# Altium schematic sheet Analog frontend.SchDoc: Analog ECG Frontend
size A4; SheetNumber: 1; SheetTotal: 5
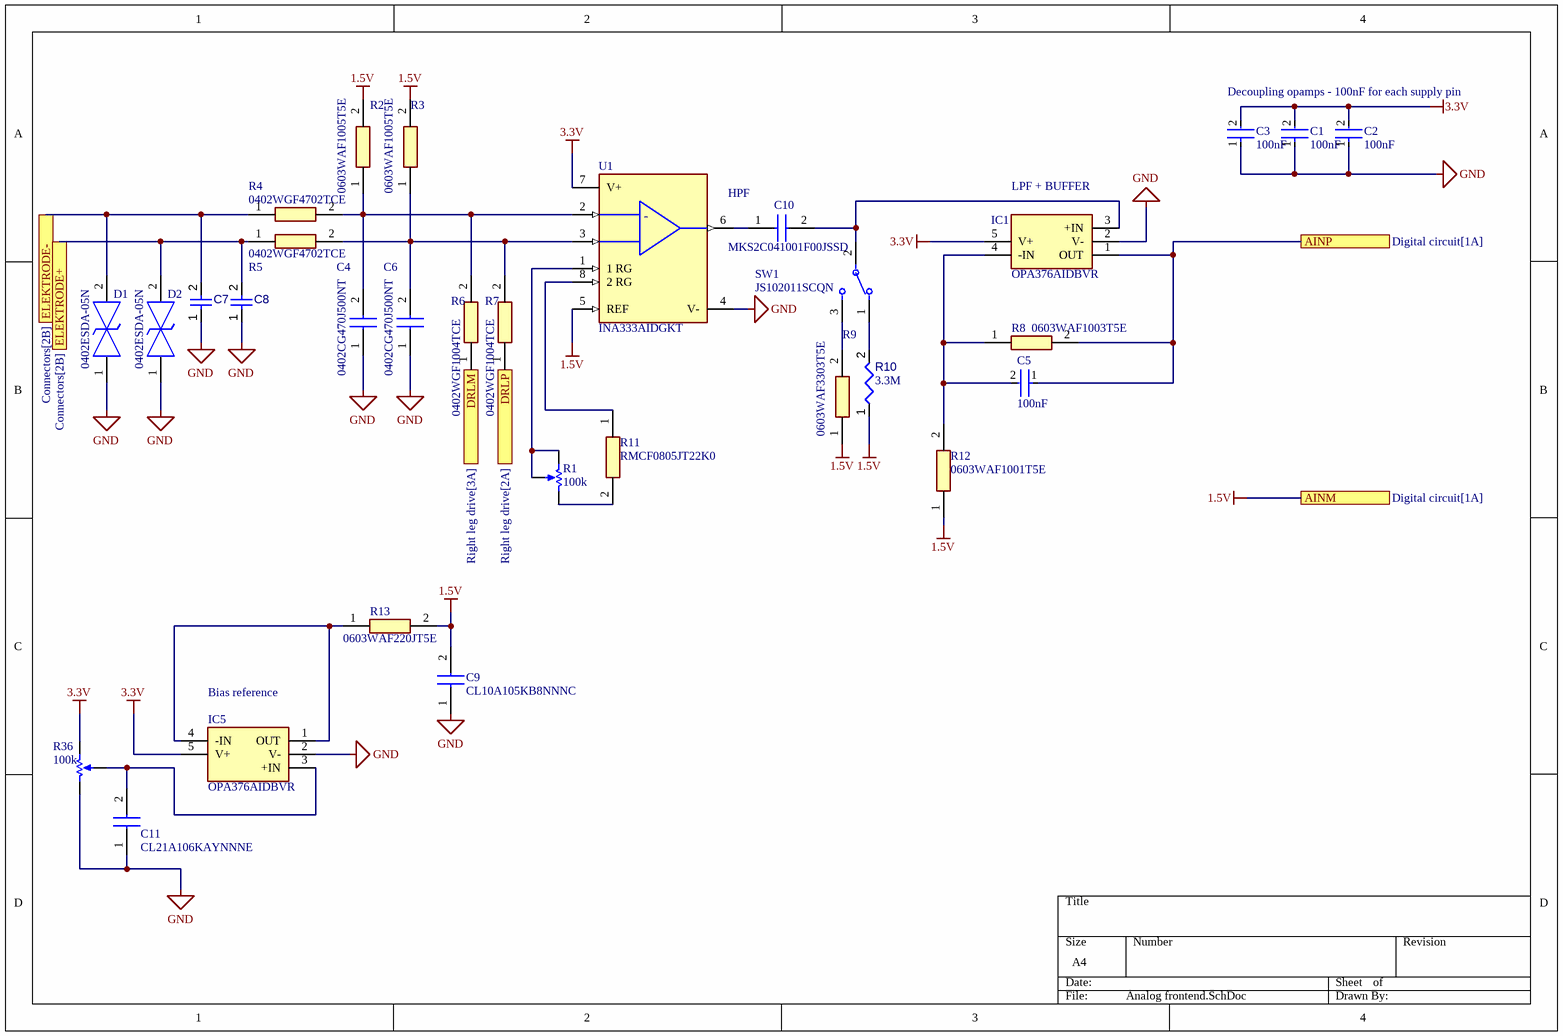
[diagram p0: Analog frontend.SchDoc]

## Parts
C1  value 100nF  [FP-CC0603-DA-IPC_B]  (hidden comment: CC0603KRX7R9BB104)
C2  value 100nF  [FP-CC0603-DA-IPC_B]  (hidden comment: CC0603KRX7R9BB104)
C3  value 100nF  [FP-CC0603-DA-IPC_B]  (hidden comment: CC0603KRX7R9BB104)
C4  0402CG470J500NT  [CAPC1005X55N]
C5  value 100nF  [FP-CC0603-DA-IPC_B]  (hidden comment: CC0603KRX7R9BB104)
C6  0402CG470J500NT  [CAPC1005X55N]
C7  TCC0402COG220J500AT  [TCC0402COG220J500AT]  (value not drawn)
C8  TCC0402COG220J500AT  [TCC0402COG220J500AT]  (value not drawn)
C9  CL10A105KB8NNNC  [CAPC1608X90N]
C10  MKS2C041001F00JSSD  [MKS2C041001F00JSSD]
C11  CL21A106KAYNNNE  [CAPC2012X145N]
D1  0402ESDA-05N  [DIONC1005X60N]
D2  0402ESDA-05N  [DIONC1005X60N]
IC1  OPA376AIDBVR  [SOT95P280X145-5N]
IC5  OPA376AIDBVR  [SOT95P280X145-5N]
R1  value 100k  [BOUR-3266W-3_V]  (hidden comment: 3266W-1-104LF)
R2  0603WAF1005T5E  [RESC1608X55N]
R3  0603WAF1005T5E  [RESC1608X55N]
R4  0402WGF4702TCE  [RESC1005X40N]
R5  0402WGF4702TCE  [RESC1005X40N]
R6  0402WGF1004TCE  [RESC1005X40N]
R7  0402WGF1004TCE  [RESC1005X40N]
R8  0603WAF1003T5E  [RESC1608X55N]
R9  0603WAF3303T5E  [RESC1608X55N]
R10  value 3.3M  [0603WAF3304T5E]  (hidden comment: 0603WAF3304T5E)
R11  RMCF0805JT22K0  [RESC2012X65N]
R12  0603WAF1001T5E  [RESC1608X55N]
R13  0603WAF220JT5E  [RESC1608X55N]
R36  value 100k  [BOUR-3266W-3_V]  (hidden comment: 3266W-1-104LF)
SW1  JS102011SCQN  [FP-JS102011SCQN-MFG]
U1  INA333AIDGKT  [FP-DGK0008A-IPC_B]

## Ports
AINM (see Digital circuit[1A]), AINP (see Digital circuit[1A]), DRLM (see Right leg drive[3A]), DRLP (see Right leg drive[2A]), ELEKTRODE+ (see Connectors[2B]), ELEKTRODE- (see Connectors[2B])

## Nets
1.5V: C9.2 R2.2 R3.2 R9.1 R10.1 R12.1 R13.2 U1.5(REF) ; port AINM
3.3V: C1.2 C2.2 C3.2 IC1.5(V+) IC5.5(V+) R36.1(CCW) U1.7(V+)
GND: C1.1 C2.1 C3.1 C4.1 C6.1 C7.1 C8.1 C9.1 C11.1 D1.1 D2.1 IC1.2(V-) IC5.2(V-) R36.3(CW) U1.4(V-)
AINP: C5.1 IC1.1(OUT) R8.2 ; port AINP
DRLM: R6.1 ; port DRLM
DRLP: R7.1 ; port DRLP
ELEKTRODE+: C8.2 D2.2 R5.1 ; port ELEKTRODE+
ELEKTRODE-: C7.2 D1.2 R4.1 ; port ELEKTRODE-
NetC4_2: C4.2 R2.1 R4.2 R6.2 U1.2(VIN-)
NetC5_2: C5.2 IC1.4(-IN) R8.1 R12.2
NetC6_2: C6.2 R3.1 R5.2 R7.2 U1.3(VIN+)
NetC10_1: C10.1 U1.6(VOUT)
NetC10_2: C10.2 IC1.3(+IN) SW1.2(C)
NetC11_2: C11.2 IC5.3(+IN) R36.2(WIPER)
NetIC5_1: IC5.1(OUT) IC5.4(-IN) R13.1
NetR1_1: R1.1(CCW) R11.2
NetR1_2: R1.2(WIPER) R1.3(CW) U1.1(1_RG)
NetR9_2: R9.2 SW1.3
NetR10_2: R10.2 SW1.1
NetR11_1: R11.1 U1.8(2_RG)

## Notes on the sheet
- Decoupling opamps - 100nF for each supply pin
- (near U1) HPF
- (near IC1) LPF + BUFFER
- (near IC5) Bias reference
- (in symbol CMP-014-00006-1) -

## Library data of the parts
C1-C3 C5 = CMP-001-00148-1: Multilayer Ceramic Capacitor, CC Series, 0.1 - F, - 10%, X7R, 50 V, 0603 [1608 Metric]; Voltage Rating: 50V; Mounting Technology: Surface Mount; Tolerance: 10%; Case/Package: 0603; Max Operating Temperature: 125°C; Min Operating Temperature: -55°C; Pins: 2; Lead Free: Lead Free; Case Code (Metric): 1608; Width: 800µm; Termination: SMD/SMT; Depth: 800µm; RoHS: Compliant; Material: Ceramic; Dielectric: X7R; Schedule B: 8532240020, 8532240020; Country of Origin: Mainland China, Taiwan; Lifecycle Status: Production; Radiation Hardening: No; Case Code (Imperial): 0603; Height: 800µm; Number of Terminals: 2; China RoHS: Compliant; Voltage Rating (DC): 50V; Export Control Classification Number (ECCN) Code: EAR99; Halogen Free: Halogen Free; Thickness: 889µm; Voltage: 50V; Length: 1.6mm; Harmonized Tariff Schedule (HTS) Code: 8532.24.00.20; REACH SVHC: Unaffected; Introduction Date: 2005-08-18; Dielectric Material: Ceramic
C4 C6 = 0402CG470J500NT: Capacitor; Manufacturer_Name: Guangdong Fenghua Advanced Tech; Datasheet Link: https://datasheet.lcsc.com/szlcsc/Guangdong-Fenghua-Advanced-Tech-0402CG470J500NT_C1567.pdf; Height: 0.55mm; Manufacturer_Part_Number: 0402CG470J500NT
C7 C8 = CMP-001-00152-1: 50V 22pF C0G ±5% 0402 Multilayer Ceramic Capacitors MLCC - SMD/SMT ROHS
C9 = CL10A105KB8NNNC: Capacitor; Manufacturer_Name: SAMSUNG; Datasheet Link: https://datasheet.datasheetarchive.com/originals/distributors/Datasheets-DGA10/2411562.pdf; Height: 0.9mm; Manufacturer_Part_Number: CL10A105KB8NNNC; Mouser Part Number: 187-CL10A105KB8NNNC; Mouser Price/Stock: https://www.mouser.co.uk/ProductDetail/Samsung-Electro-Mechanics/CL10A105KB8NNNC?qs=ktYoCbbtCSJz4pFCLWXd5g%3D%3D; Arrow Part Number: CL10A105KB8NNNC; Arrow Price/Stock: https://www.arrow.com/en/products/cl10a105kb8nnnc/samsung-electro-mechanics.html?utm_currency=USD&region=nac
C10 = MKS2C041001F00JSSD: Capacitor; Manufacturer_Name: WIMA; Datasheet Link: https://www.digikey.com/en/products/detail/wima/MKS2C041001F00JSSD/19251598; Height: 10mm; Manufacturer_Part_Number: MKS2C041001F00JSSD; Mouser Part Number: 505-MKS21.0/63/5; Mouser Price/Stock: https://www.mouser.co.uk/ProductDetail/WIMA/MKS2C041001F00JSSD?qs=ISKKXg98%252B1lQgUuGZjf9mQ%3D%3D; Arrow Part Number: MKS2C041001F00JSSD; Arrow Price/Stock: https://www.arrow.com/en/products/mks2c041001f00jssd/wima?region=europe
C11 = CL21A106KAYNNNE: Capacitor; Manufacturer_Name: SAMSUNG; Datasheet Link: https://datasheet.datasheetarchive.com/originals/distributors/Datasheets_SAMA/6a45835c9b7400e9b49c55c38a8ff4a2.pdf; Height: 1.45mm; Manufacturer_Part_Number: CL21A106KAYNNNE; Mouser Part Number: 187-CL21A106KAYNNNE; Mouser Price/Stock: https://www.mouser.co.uk/ProductDetail/Samsung-Electro-Mechanics/CL21A106KAYNNNE?qs=yOVawPpwOwmTXAd4dJtNjA%3D%3D; Arrow Part Number: CL21A106KAYNNNE; Arrow Price/Stock: https://www.arrow.com/en/products/cl21a106kaynnne/samsung-electro-mechanics.html?utm_currency=USD&region=nac
D1 D2 = 0402ESDA-05N: TVS Diode (Bi-directional); Manufacturer_Name: Bourne Semicon; Datasheet Link: https://datasheet.lcsc.com/szlcsc/1811061308_Bourne-Semicon-Shenzhen-0402ESDA-05N_C316049.pdf; Height: 0.6mm; Manufacturer_Part_Number: 0402ESDA-05N
IC1 IC5 = OPA376AIDBVR: Integrated Circuit; Manufacturer_Name: Texas Instruments; Datasheet Link: http://www.ti.com/lit/gpn/OPA376; Height: 1.45mm; Manufacturer_Part_Number: OPA376AIDBVR; Mouser Part Number: 595-OPA376AIDBVR; Mouser Price/Stock: https://www.mouser.co.uk/ProductDetail/Texas-Instruments/OPA376AIDBVR?qs=xL7PkI2RoJ57GVtJklM7uw%3D%3D; Arrow Part Number: OPA376AIDBVR; Arrow Price/Stock: https://www.arrow.com/en/products/opa376aidbvr/texas-instruments.html?utm_currency=USD&region=europe
R1 R36 = CMP-009-00233-1: Trimmer, Cermet, Rest 100 Kilohms, Pcb, Pwr-rtg 0.25W, Dim 0.264INLX0.177INWX0.285INH; Insulation Resistance: 1GΩ; Lead Length: 4.88mm; Lead Diameter: 460µm; Voltage Rating: 300V; Max Power Dissipation: 250mW; Pitch: 2.54mm; Number of Turns: 12; Tolerance: 10%; Temperature Coefficient: 100ppm/°C; Composition: Cermet; Number of Terminals: 3; Military Standard: Not; REACH SVHC: Affected; Thickness: 5.59mm; Taper: Linear; Max Operating Temperature: 125°C; Contact Plating: Tin; Depth: 4.5mm; RoHS: Compliant; Min Operating Temperature: -55°C; Pins: 3; Termination: Pin; Height: 7.24mm; Schedule B: 8533400080, 8533400080; Working Voltage: 300V; Voltage Rating (AC): 300V; Voltage Rating (DC): 300V; Width: 4.5mm; Radiation Hardening: No; Lifecycle Status: Production; Weight: 425.242847mg; Type: Potentiometer; Color: Blue; Length: 6.71mm; Power Rating: 250mW
R2 R3 = 0603WAF1005T5E: Resistor; Manufacturer_Name: ROYALOHM; Datasheet Link: https://eu.mouser.com/datasheet/3/5925/1/1.pdf; Height: 0.55mm; Manufacturer_Part_Number: 0603WAF1005T5E; Mouser Part Number: 303-0603WAF1005T5E; Mouser Price/Stock: https://www.mouser.co.uk/ProductDetail/Royalohm/0603WAF1005T5E?qs=e8oIoAS2J1TtIpBlPWLC5w%3D%3D
R4 R5 = 0402WGF4702TCE: Resistor; Manufacturer_Name: UNI-ROYAL(Uniroyal Elec); Datasheet Link: https://datasheet.lcsc.com/szlcsc/Uniroyal-Elec-0402WGF4702TCE_C25792.pdf; Height: 0.4mm; Manufacturer_Part_Number: 0402WGF4702TCE
R6 R7 = 0402WGF1004TCE: Resistor; Manufacturer_Name: ROYALOHM; Datasheet Link: https://www.mouser.ca/datasheet/2/1365/1-3044649.pdf; Height: 0.4mm; Manufacturer_Part_Number: 0402WGF1004TCE; Mouser Part Number: 303-0402WGF1004TCE; Mouser Price/Stock: https://www.mouser.co.uk/ProductDetail/Royalohm/0402WGF1004TCE?qs=e8oIoAS2J1Sm8qYhjADD%252Bg%3D%3D
R8 = 0603WAF1003T5E: Resistor; Manufacturer_Name: UNI-ROYAL(Uniroyal Elec); Datasheet Link: https://datasheet.lcsc.com/szlcsc/Uniroyal-Elec-0603WAF1003T5E_C25803.pdf; Height: 0.55mm; Manufacturer_Part_Number: 0603WAF1003T5E
R9 = 0603WAF3303T5E: Resistor; Manufacturer_Name: Uniroyal Elec; Datasheet Link: https://datasheet.lcsc.com/szlcsc/Uniroyal-Elec-0603WAF3303T5E_C23137.pdf; Height: 0.55mm; Manufacturer_Part_Number: 0603WAF3303T5E
R10 = CMP-009-00239-1: Res Thick Film 0603 3.3M Ohm 1% 0.1W(1/10W) ±100ppm/C Pad SMD T/R; Working Voltage: 75V; Power Rating: 100mW; Temperature Coefficient: 100ppm/°C; Lifecycle Status: Production; REACH SVHC: Unaffected; Case/Package: 0603; Number of Terminals: 2; Mounting Technology: Surface Mount; Width: 800µm; RoHS: Compliant; China RoHS: Non-Compliant; Length: 1.6mm; Tolerance: 1%; Max Operating Temperature: 155°C; Height: 450µm; Min Operating Temperature: -55°C
R11 = RMCF0805JT22K0: Resistor; Manufacturer_Name: Stackpole Electronics; Datasheet Link: https://cs.seielect.com/catalog/SEI-RMCF_RMCP.pdf; Height: 0.65mm; Manufacturer_Part_Number: RMCF0805JT22K0; Mouser Part Number: 708-RMCF0805JT22K0; Mouser Price/Stock: https://www.mouser.co.uk/ProductDetail/SEI-Stackpole/RMCF0805JT22K0?qs=FESYatJ8odJj8AR7KQYlug%3D%3D; Arrow Part Number: RMCF0805JT22K0; Arrow Price/Stock: https://www.arrow.com/en/products/rmcf0805jt22k0/stackpole-electronics?region=nac
R12 = 0603WAF1001T5E: Resistor; Manufacturer_Name: UNI-ROYAL(Uniroyal Elec); Datasheet Link: https://datasheet.lcsc.com/szlcsc/Uniroyal-Elec-0603WAF1001T5E_C21190.pdf; Height: 0.55mm; Manufacturer_Part_Number: 0603WAF1001T5E
R13 = 0603WAF220JT5E: Resistor; Manufacturer_Name: UNI-ROYAL(Uniroyal Elec); Datasheet Link: https://www.lcsc.com/datasheet/lcsc_datasheet_2206010100_UNI-ROYAL-Uniroyal-Elec-0603WAF220JT5E_C23345.pdf; Height: 0.55mm; Manufacturer_Part_Number: 0603WAF220JT5E
SW1 = CMP-011-00018-1: Slide Switch, 2 Positions, SPDT, Latched, 0.3A, 6VDC, Solder Terminal, Surface Mount-straight; Contact Resistance: 70mΩ; Number of Positions: 1; Actuator Length: 2.0066mm; Switch Travel: 2mm; Electrical Life: 5kcycles; Current Rating: 300mA; Actuator Material: Nylon; Switch Function: On-On; Insulation Resistance: 100MΩ; Voltage Rating (DC): 6V; Min Operating Temperature: -40°C; Radiation Hardening: No; Orientation: Straight; Throw Configuration: SPDT; Introduction Date: 2009-12-16; Housing Material: Nylon; Length: 8.5mm; Harmonized Tariff Schedule (HTS) Code: 8536.50.90.50; Country of Origin: Mainland China; Color: Black; Export Control Classification Number (ECCN) Code: EAR99; REACH SVHC: Unaffected; Case/Package: SMD/SMT; Contact Current Rating: 300mA; Contact Plating: Silver; Life (Cycles): 5kcycles; Packaging: Tape and Reel; Mounting Technology: Surface Mount; Termination: Solder; RoHS: Compliant; Max Current Rating: 300mA; Height: 3.5mm; Terminal Material: Brass; Max Voltage Rating (DC): 6V; Max Operating Temperature: 85°C; Lifecycle Status: Production; Depth: 7.5mm
U1 = CMP-014-00006-1: IC INST AMP 1 CIRCUIT 8VSSOP Instrumentation Amplifier 1 Circuit Rail-to-Rail 8-VSSOP; Manufacturer Lifecycle Status: ACTIVE; Number of Amplifiers: 1; Operating Supply Current: 50µA; Max Junction Temperature (Tj): 150°C; Common Mode Rejection Ratio: 100dB; Max Dual Supply Voltage: 2.75V; Min Supply Voltage: 1.8V; Max Supply Voltage: 5.5V; Min Dual Supply Voltage: 900mV; Input Offset Voltage (Vos): 25µV; Output Current per Channel: 40mA; Gain Bandwidth Product: 150kHz; Max Supply Current: 75µA; Value: 100GΩ; Power Supply Rejection Ratio (PSRR): 120dB; Number of Elements: 3; Input Bias Current: 70pA; Slew Rate: 0.16V/µs; Voltage Gain: 60dB; Thickness: 970µm; Width: 3mm; Number of Circuits: 1; Quiescent Current: 50µA; Lead Free: Lead Free; Height: 0m; Max Operating Temperature: 125°C; REACH SVHC: Unaffected; Schedule B: 8542330000, 8542330000; Radiation Hardening: No; Length: 3mm; RoHS: Compliant; Number of Channels: 1; -3db Bandwidth: 150kHz; Nominal Supply Current: 50µA; Case/Package: VSSOP; Ambient Temperature Range High: 125°C; Bandwidth: 150kHz; Lifecycle Status: Production; Pins: 8; Min Operating Temperature: -40°C; Weight: 26.506804mg